# Altium schematic sheet USB_OTG_FS.SchDoc (part 3 of 3)
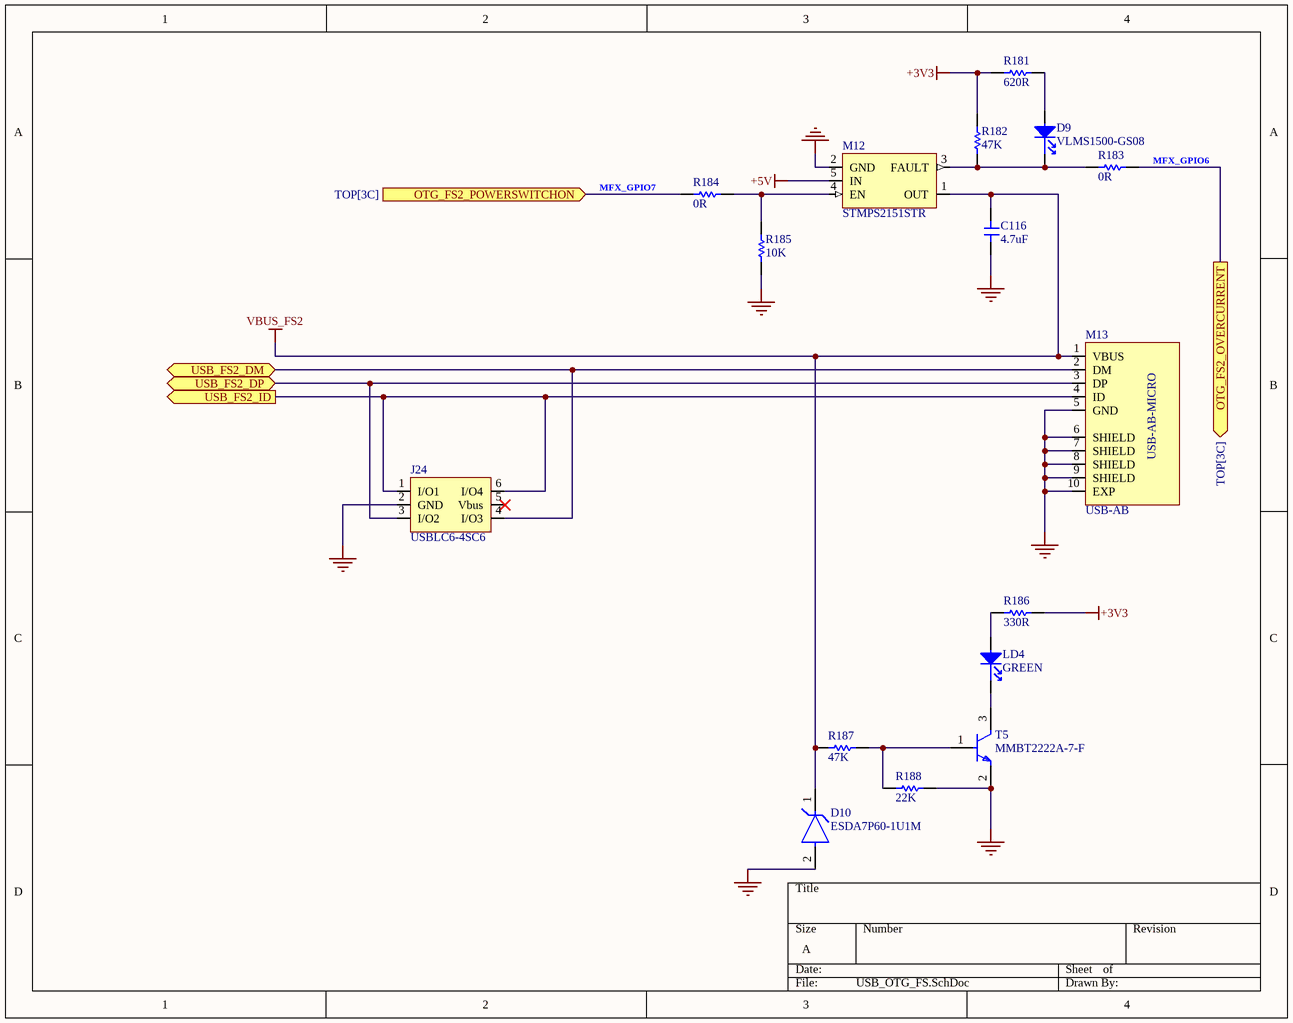
[diagram p2: USB_OTG_FS.SchDoc]

## Library data of the parts (continued)
R188 = RC0603FR-0722KL: Res Thick Film 0603 22K Ohm 1% 0.1W(1/10W) ±100ppm/C Pad SMD T/R; Manufacturer: Yageo Group; Current Rating: 290mA; Max Power Dissipation: 100mW; Value: 22kΩ; Shielding: Unshielded; Temperature Coefficient: 100ppm/°C; Voltage Rating: 75V; Voltage Rating (AC): 50V; Supplier: DigiKey; Supplier Part Number: 311-22.0KHRCT-ND; Manufacturer Part Number: RC0603FR-0722KL; RoHS: Compliant; Category: Chip SMD Resistors; Stock: 461772; Pricing: 1=0.1, 10=0.025, 25=0.0188, 50=0.015, 100=0.0122, 250=0.0094, 500=0.00782, 1000=0.00661 (USD); Case/Package: 0603; Case Code (Imperial): 0603; China RoHS: Non-Compliant; Composition: Thick Film; Contact Plating: Tin; Country of Origin: Mainland China, Taiwan; Depth: 800µm; Diameter: 8.5mm; Export Control Classification Number (ECCN) Code: EAR99; Features: Moisture Resistant; Height: 450µm; Harmonized Tariff Schedule (HTS) Code: 8533.21.00.30; Introduction Date: 2008-07-18; Lead Free: Lead Free; Lead Pitch: 5mm; Length: 1.6mm; Lifecycle Status: Production; Max Operating Temperature: 155°C; Military Standard: Not; Min Operating Temperature: -55°C; Mounting Technology: Surface Mount; Pins: 2; Number of Terminals: 2; Number of Terminations: 2; Packaging: Bulk; Power Rating: 100mW; Radiation Hardening: No; REACH SVHC: Yes; Schedule B: 8533210045, 8533210045|8533210045|8533210045|8533210045|8533210045|8533210045|8533210045|8533210045|8533210045|8533210045|8533210045|8533210045|8533210045|8533210045|8533210045|8533210045|8533210045|8533210045|8533210045|8533210045|8533210045|8533210045|8533210045|85; Termination: SMD/SMT; Tolerance: 1%; Voltage Rating (DC): 50V; Width: 800µm; Working Voltage: 75V; ComponentLink1URL: https://datasheet.octopart.com:443/RC0603FR-0722KL-Yageo-datasheet-175887523.pdf?src-supplier=IHS; ComponentLink1Description: https://datasheet.octopart.com:443/RC0603FR-0722KL-Yageo-datasheet-175887523.pdf?src-supplier=IHS; ComponentLink2URL: https://datasheet.octopart.com:443/RC0603FR-0722KL-Yageo-datasheet-62067350.pdf?src-supplier=Farnell; ComponentLink2Description: https://datasheet.octopart.com:443/RC0603FR-0722KL-Yageo-datasheet-62067350.pdf?src-supplier=Farnell; ComponentLink3URL: https://datasheet.octopart.com:443/RC0603FR-0722KL-Yageo-datasheet-13691069.pdf?src-supplier=Farnell; ComponentLink3Description: https://datasheet.octopart.com:443/RC0603FR-0722KL-Yageo-datasheet-13691069.pdf?src-supplier=Farnell; ComponentLink4URL: https://datasheet.octopart.com:443/RC0603FR-0722KL-Yageo-datasheet-79472498.pdf?src-supplier=Upverter; ComponentLink4Description: https://datasheet.octopart.com:443/RC0603FR-0722KL-Yageo-datasheet-79472498.pdf?src-supplier=Upverter; ComponentLink5URL: https://datasheet.octopart.com:443/RC0603FR-0722KL-Yageo-datasheet-103092701.pdf?src-supplier=Upverter; ComponentLink5Description: https://datasheet.octopart.com:443/RC0603FR-0722KL-Yageo-datasheet-103092701.pdf?src-supplier=Upverter; ComponentLink6URL: https://datasheet.octopart.com:443/RC0603FR-0722KL-Yageo-datasheet-8328172.pdf?src-supplier=element14+APAC; ComponentLink6Description: https://datasheet.octopart.com:443/RC0603FR-0722KL-Yageo-datasheet-8328172.pdf?src-supplier=element14+APAC; ComponentLink7URL: https://datasheet.octopart.com:443/RC0603FR-0722KL-Yageo-Group-datasheet-190305687.pdf?src-supplier=Future+Electronics; ComponentLink7Description: https://datasheet.octopart.com:443/RC0603FR-0722KL-Yageo-Group-datasheet-190305687.pdf?src-supplier=Future+Electronics; ComponentLink8URL: https://datasheet.octopart.com:443/RC0603FR-0722KL-Yageo-datasheet-164759695.pdf?src-supplier=Future+Electronics; ComponentLink8Description: https://datasheet.octopart.com:443/RC0603FR-0722KL-Yageo-datasheet-164759695.pdf?src-supplier=Future+Electronics; ComponentLink9URL: https://datasheet.octopart.com:443/RC0603FR-0722KL-Yageo-datasheet-137700087.pdf?src-supplier=Future+Electronics; ComponentLink9Description: https://datasheet.octopart.com:443/RC0603FR-0722KL-Yageo-datasheet-137700087.pdf?src-supplier=Future+Electronics; ComponentLink10URL: https://datasheet.octopart.com:443/RC0603FR-0722KL-Yageo-datasheet-127823281.pdf?src-supplier=Future+Electronics; ComponentLink10Description: https://datasheet.octopart.com:443/RC0603FR-0722KL-Yageo-datasheet-127823281.pdf?src-supplier=Future+Electronics; ComponentLink11URL: https://datasheet.octopart.com:443/RC0603FR-0722KL-Yageo-datasheet-27584510.pdf?src-supplier=Future+Electronics; ComponentLink11Description: https://datasheet.octopart.com:443/RC0603FR-0722KL-Yageo-datasheet-27584510.pdf?src-supplier=Future+Electronics; ComponentLink12URL: https://datasheet.octopart.com:443/RC0603FR-0722KL-Yageo-datasheet-15599030.pdf?src-supplier=Future+Electronics; ComponentLink12Description: https://datasheet.octopart.com:443/RC0603FR-0722KL-Yageo-datasheet-15599030.pdf?src-supplier=Future+Electronics; ComponentLink13URL: https://datasheet.octopart.com:443/RC0603FR-0722KL-Yageo-datasheet-8324193.pdf?src-supplier=Future+Electronics; ComponentLink13Description: https://datasheet.octopart.com:443/RC0603FR-0722KL-Yageo-datasheet-8324193.pdf?src-supplier=Future+Electronics; ComponentLink14URL: https://datasheet.octopart.com:443/RC0603FR-0722KL-Yageo-datasheet-12596169.pdf?src-supplier=Newark; ComponentLink14Description: https://datasheet.octopart.com:443/RC0603FR-0722KL-Yageo-datasheet-12596169.pdf?src-supplier=Newark; ComponentLink15URL: https://datasheet.octopart.com:443/RC0603FR-0722KL-Yageo-datasheet-34211833.pdf?src-supplier=Newark; ComponentLink15Description: https://datasheet.octopart.com:443/RC0603FR-0722KL-Yageo-datasheet-34211833.pdf?src-supplier=Newark; ComponentLink16URL: https://datasheet.octopart.com:443/RC0603FR-0722KL-Yageo-Group-datasheet-189192902.pdf?src-supplier=LCSC; ComponentLink16Description: https://datasheet.octopart.com:443/RC0603FR-0722KL-Yageo-Group-datasheet-189192902.pdf?src-supplier=LCSC; ComponentLink17URL: https://datasheet.octopart.com/RC0603FR-0722KL-Yageo-datasheet-73766026.pdf; ComponentLink17Description: https://datasheet.octopart.com/RC0603FR-0722KL-Yageo-datasheet-73766026.pdf; ComponentLink18URL: https://datasheet.octopart.com:443/RC0603FR-0722KL-Yageo-datasheet-118562.pdf?src-supplier=DigiKey; ComponentLink18Description: https://datasheet.octopart.com:443/RC0603FR-0722KL-Yageo-datasheet-118562.pdf?src-supplier=DigiKey; ComponentLink19URL: http://sigma.octopart.com:80/conflict_mineral_statement/Yageo-company-3.pdf?src-supplier=Compliance+Statements; ComponentLink19Description: http://sigma.octopart.com:80/conflict_mineral_statement/Yageo-company-3.pdf?src-supplier=Compliance+Statements; ComponentLink20URL: http://sigma.octopart.com:80/rohs_statement/Yageo-company-2.pdf?src-supplier=Compliance+Statements; ComponentLink20Description: http://sigma.octopart.com:80/rohs_statement/Yageo-company-2.pdf?src-supplier=Compliance+Statements
T5 = MMBT2222A-7-F: Bipolar (BJT) Single Transistor, NPN, 40 V, 600 mA, 300 mW, SOT-23, Surface Mount; Manufacturer: Diodes Inc.; Collector Base Voltage (VCBO): 75V; Collector Emitter Breakdown Voltage: 40V; Collector Emitter Saturation Voltage: 1V; Continuous Collector Current: 600mA; Current: 1A; Emitter Base Voltage (VEBO): 6V; Frequency: 300MHz; hFE Min: 40; Max Junction Temperature (Tj): 150°C; Max Power Dissipation: 300mW; Number of Elements: 1; Power Dissipation: 310mW; Supplier: DigiKey; Supplier Part Number: MMBT2222A-FDITR-ND; Manufacturer Part Number: MMBT2222A-7-F; RoHS: Compliant; Category: BJTs; Stock: 578136; Pricing: 3000=0.03404, 9000=0.02827 (USD); Case/Package: SOT-23; China RoHS: Compliant; Collector Emitter Voltage (VCEO): 40V; Contact Plating: Tin; Country of Origin: Mainland China, Taiwan; Current Rating: 600mA; Export Control Classification Number (ECCN) Code: EAR99; Element Configuration: Single; Gain Bandwidth Product: 300MHz; Height: 1.1mm; Introduction Date: 2003-04-14; Lead Free: Lead Free; Length: 3mm; Lifecycle Status: Production; Max Breakdown Voltage: 40V; Max Collector Current: 600mA; Clock Frequency: 300MHz; Max Operating Temperature: 150°C; Min Operating Temperature: -55°C; Mounting Technology: Surface Mount; Pins: 3; Number of Terminals: 3; Packaging: Tape and Reel; Polarity: NPN; Radiation Hardening: No; REACH SVHC: Yes; Schedule B: 8541210080, 8541210080|8541210080|8541210080|8541210080|8541210080|8541210080|8541210080|8541210080|8541210080|8541210080|8541210080|8541210080|8541210080|8541210080|8541210080|8541210080|8541210080|8541210080|8541210080|8541210080|8541210080|8541210080|8541210080|85; Termination: SMD/SMT; Transition Frequency: 300MHz; Voltage: 40V; Voltage Rating (DC): 40V; Weight: 7.994566mg; Width: 1.4mm; ComponentLink1URL: https://datasheet.octopart.com:443/MMBT2222A-7-F-Diodes-Inc.-datasheet-179056681.pdf?src-supplier=Newark; ComponentLink1Description: https://datasheet.octopart.com:443/MMBT2222A-7-F-Diodes-Inc.-datasheet-179056681.pdf?src-supplier=Newark; ComponentLink2URL: https://datasheet.octopart.com:443/MMBT2222A-7-F-Diodes-Inc.-datasheet-62305184.pdf?src-supplier=Newark; ComponentLink2Description: https://datasheet.octopart.com:443/MMBT2222A-7-F-Diodes-Inc.-datasheet-62305184.pdf?src-supplier=Newark; ComponentLink3URL: https://datasheet.octopart.com:443/MMBT2222A-7-F-Diodes-Inc.-datasheet-8332362.pdf?src-supplier=Newark; ComponentLink3Description: https://datasheet.octopart.com:443/MMBT2222A-7-F-Diodes-Inc.-datasheet-8332362.pdf?src-supplier=Newark; ComponentLink4URL: https://datasheet.octopart.com:443/MMBT2222A-7-F-Diodes-Inc.-datasheet-41567372.pdf?src-supplier=Upverter; ComponentLink4Description: https://datasheet.octopart.com:443/MMBT2222A-7-F-Diodes-Inc.-datasheet-41567372.pdf?src-supplier=Upverter; ComponentLink5URL: https://sigma.octopart.com:443/138706058/technical_drawing/Diodes-Inc.-MMBT2222A-7-F.pdf?src-supplier=Upverter; ComponentLink5Description: https://sigma.octopart.com:443/138706058/technical_drawing/Diodes-Inc.-MMBT2222A-7-F.pdf?src-supplier=Upverter; ComponentLink6URL: https://sigma.octopart.com:443/138895845/technical_drawing/Diodes-Inc.-MMBT2222A-7-F.pdf?src-supplier=Diodes+Inc+SCT; ComponentLink6Description: https://sigma.octopart.com:443/138895845/technical_drawing/Diodes-Inc.-MMBT2222A-7-F.pdf?src-supplier=Diodes+Inc+SCT; ComponentLink7URL: https://datasheet.octopart.com:443/MMBT2222A-7-F-Diodes-Inc.-datasheet-13700595.pdf?src-supplier=Diodes+Inc+SCT; ComponentLink7Description: https://datasheet.octopart.com:443/MMBT2222A-7-F-Diodes-Inc.-datasheet-13700595.pdf?src-supplier=Diodes+Inc+SCT; ComponentLink8URL: https://datasheet.octopart.com:443/MMBT2222A-7-F-Diodes-Inc.-datasheet-62305186.pdf?src-supplier=Future+Electronics; ComponentLink8Description: https://datasheet.octopart.com:443/MMBT2222A-7-F-Diodes-Inc.-datasheet-62305186.pdf?src-supplier=Future+Electronics; ComponentLink9URL: https://datasheet.octopart.com:443/MMBT2222A-7-F-Diodes-Inc.-datasheet-14065194.pdf?src-supplier=iiiC; ComponentLink9Description: https://datasheet.octopart.com:443/MMBT2222A-7-F-Diodes-Inc.-datasheet-14065194.pdf?src-supplier=iiiC; ComponentLink10URL: https://datasheet.octopart.com:443/MMBT2222A-7-F-Diodes-Inc.-datasheet-7278093.pdf?src-supplier=Jameco+(USA); ComponentLink10Description: https://datasheet.octopart.com:443/MMBT2222A-7-F-Diodes-Inc.-datasheet-7278093.pdf?src-supplier=Jameco+(USA); ComponentLink11URL: https://datasheet.octopart.com:443/MMBT2222A-7-F-Diodes-Inc.-datasheet-55952.pdf?src-supplier=Garrett; ComponentLink11Description: https://datasheet.octopart.com:443/MMBT2222A-7-F-Diodes-Inc.-datasheet-55952.pdf?src-supplier=Garrett; ComponentLink12URL: https://datasheet.octopart.com:443/MMBT2222A-7-F-Diodes-Inc.-datasheet-135438.pdf?src-supplier=DigiKey; ComponentLink12Description: https://datasheet.octopart.com:443/MMBT2222A-7-F-Diodes-Inc.-datasheet-135438.pdf?src-supplier=DigiKey; ComponentLink13URL: http://sigma.octopart.com:80/15540767/rohs_certificate/Diodes-Inc.-MMBT2222A-7-F.pdf?src-supplier=Compliance+Statements; ComponentLink13Description: http://sigma.octopart.com:80/15540767/rohs_certificate/Diodes-Inc.-MMBT2222A-7-F.pdf?src-supplier=Compliance+Statements

## Notes on the sheet
- (in symbol 105017-0001) USB-AB-MICRO